# Altium schematic sheet 02_PowerStage.SchDoc
size A3; SheetNumber: 3; SheetTotal: 6
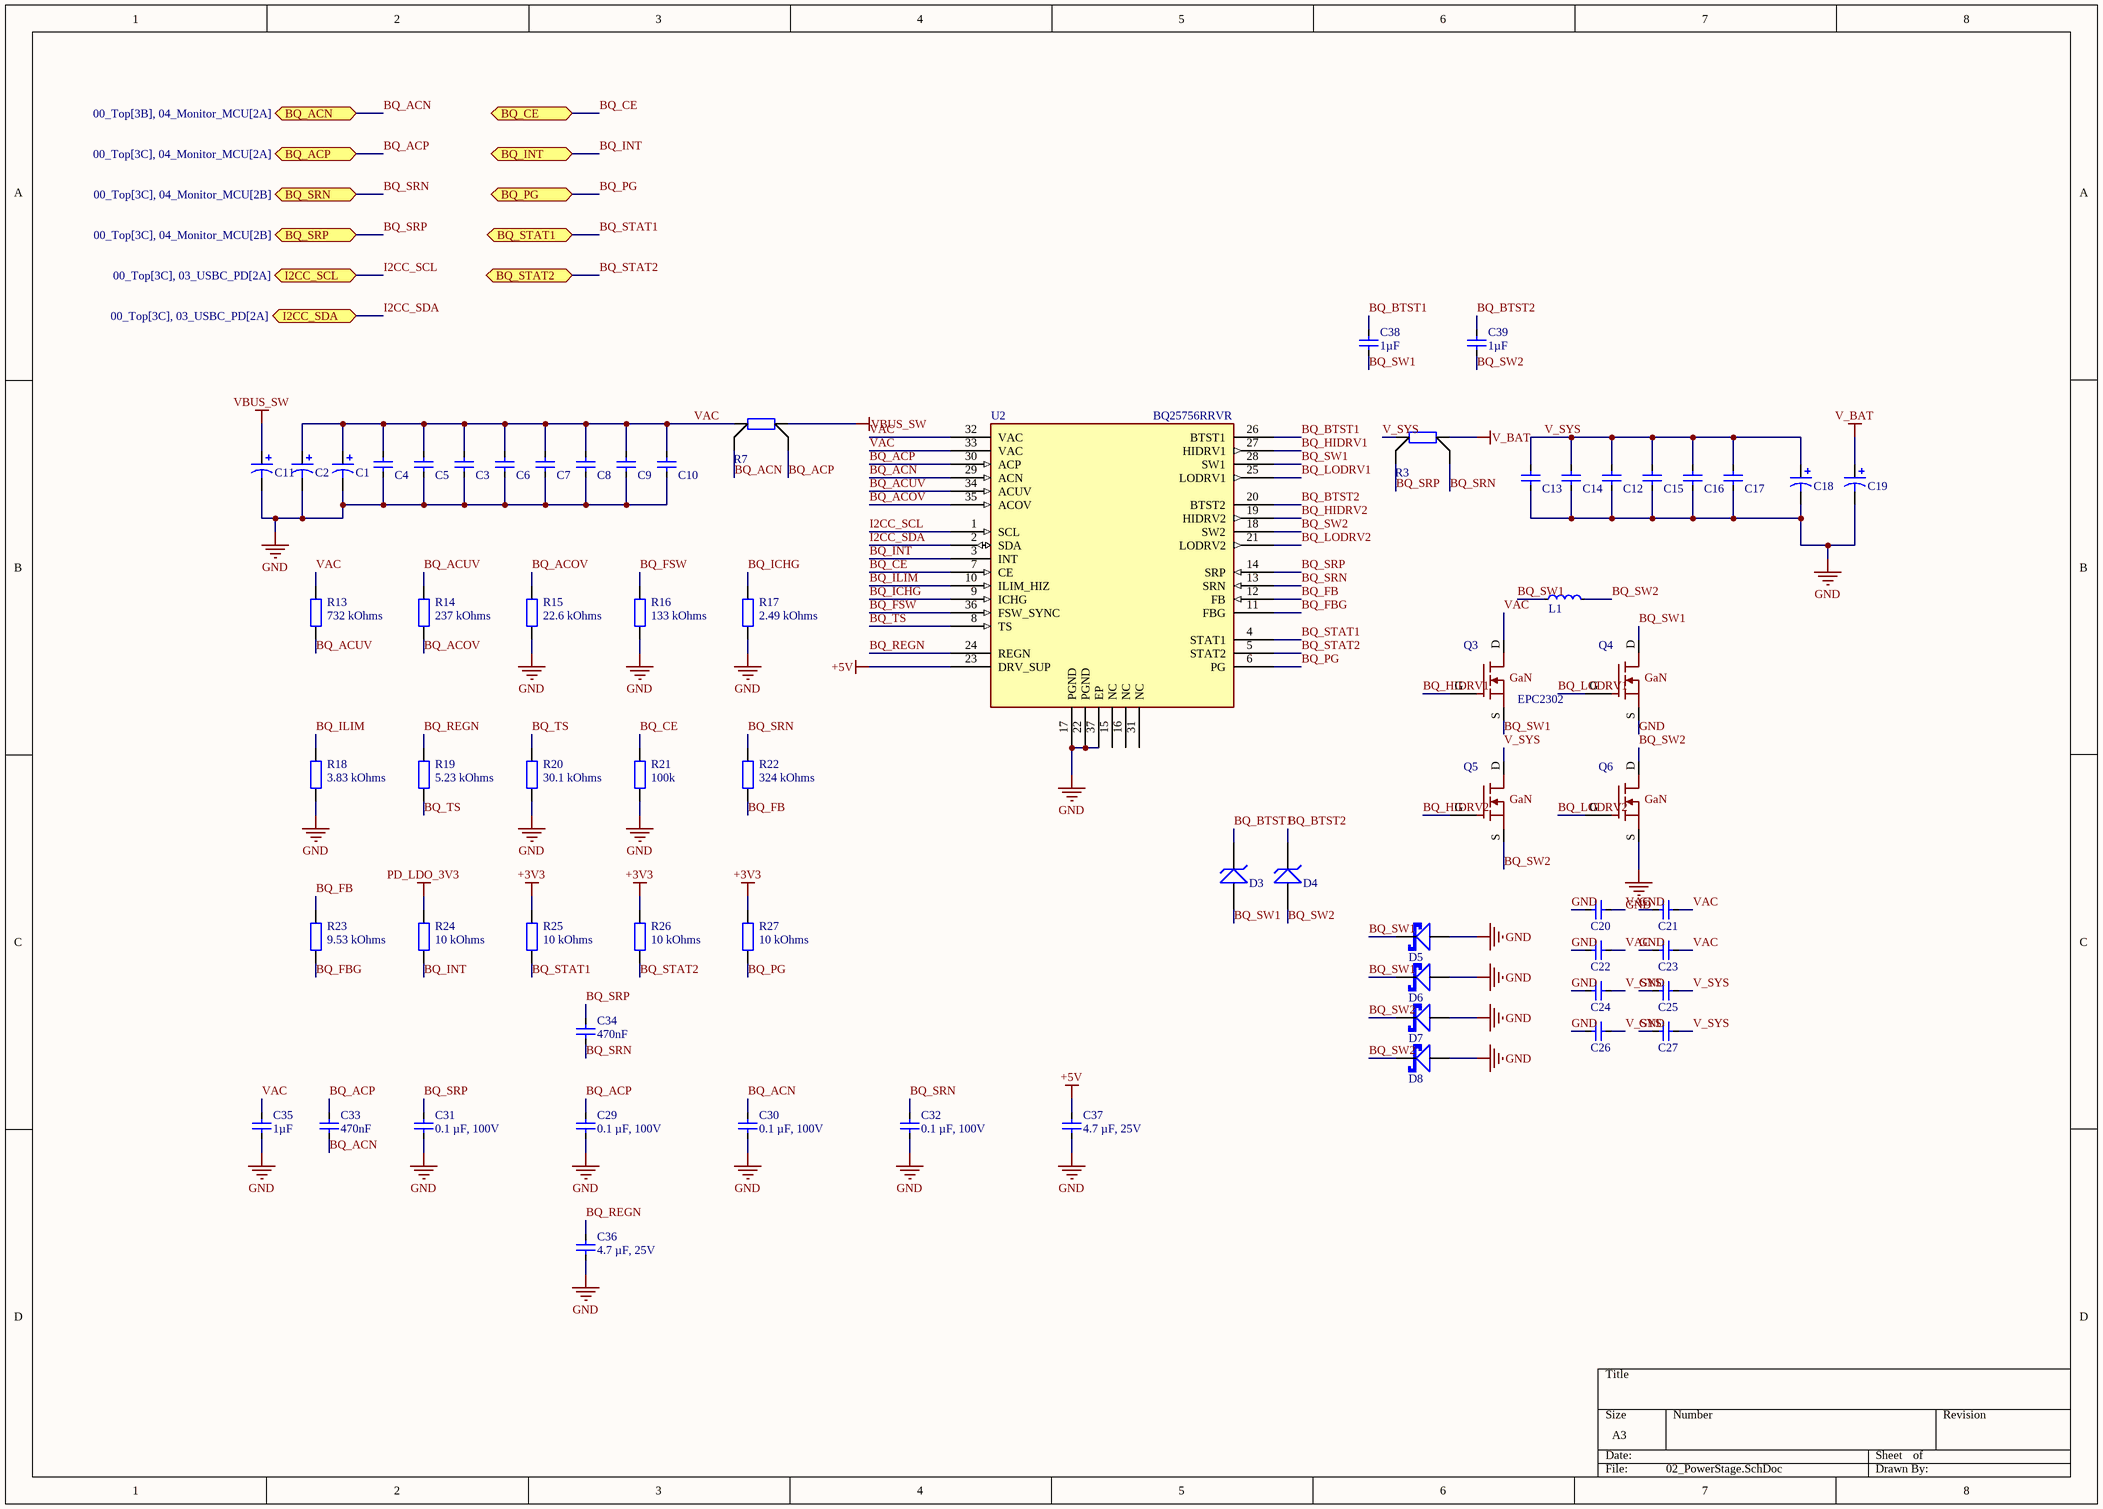
[diagram p0: 02_PowerStage.SchDoc]

## Parts
C1  100µF 80V  [CAPAE1030X1280N]  (value not drawn)
C2  100µF 80V  [CAPAE1030X1280N]  (value not drawn)
C3  10 µF, 100V  [CAPC3225X30N]  (value not drawn)
C4  10 µF, 100V  [CAPC3225X30N]  (value not drawn)
C5  10 µF, 100V  [CAPC3225X30N]  (value not drawn)
C6  10 µF, 100V  [CAPC3225X30N]  (value not drawn)
C7  10 µF, 100V  [CAPC3225X30N]  (value not drawn)
C8  10 µF, 100V  [CAPC3225X30N]  (value not drawn)
C9  10 µF, 100V  [CAPC3225X30N]  (value not drawn)
C10  10 µF, 100V  [CAPC3225X30N]  (value not drawn)
C11  100µF 80V  [CAPAE1030X1280N]  (value not drawn)
C12  10 µF, 100V  [CAPC3225X30N]  (value not drawn)
C13  10 µF, 100V  [CAPC3225X30N]  (value not drawn)
C14  10 µF, 100V  [CAPC3225X30N]  (value not drawn)
C15  10 µF, 100V  [CAPC3225X30N]  (value not drawn)
C16  10 µF, 100V  [CAPC3225X30N]  (value not drawn)
C17  10 µF, 100V  [CAPC3225X30N]  (value not drawn)
C18  100µF 80V  [CAPAE1030X1280N]  (value not drawn)
C19  100µF 80V  [CAPAE1030X1280N]  (value not drawn)
C20  0.1 µF, 100V  [CAPC1608X10N]  (value not drawn)
C21  10000 pF, 100V  [CAPC1608X10N]  (value not drawn)
C22  0.1 µF, 100V  [CAPC1608X10N]  (value not drawn)
C23  10000 pF, 100V  [CAPC1608X10N]  (value not drawn)
C24  0.1 µF, 100V  [CAPC1608X10N]  (value not drawn)
C25  10000 pF, 100V  [CAPC1608X10N]  (value not drawn)
C26  0.1 µF, 100V  [CAPC1608X10N]  (value not drawn)
C27  10000 pF, 100V  [CAPC1608X10N]  (value not drawn)
C29  0.1 µF, 100V  [CAPC1608X10N]
C30  0.1 µF, 100V  [CAPC1608X10N]
C31  0.1 µF, 100V  [CAPC1608X10N]
C32  0.1 µF, 100V  [CAPC1608X10N]
C33  470nF  [CAPC1608X10N]
C34  470nF  [CAPC1608X10N]
C35  1µF  [CAPC3216X20N]
C36  4.7 µF, 25V  [CAPC1608X10N]
C37  4.7 µF, 25V  [CAPC1608X10N]
C38  1µF  [CAPC1608X10N]
C39  1µF  [CAPC1608X10N]
D3  BZX384C5V6-G3-08  [NXP-SOD323]  (value not drawn)
D4  BZX384C5V6-G3-08  [NXP-SOD323]  (value not drawn)
D5  PMEG10030ELPX  [ST-SOD128FLAT]  (value not drawn)
D6  PMEG10030ELPX  [ST-SOD128FLAT]  (value not drawn)
D7  PMEG10030ELPX  [ST-SOD128FLAT]  (value not drawn)
D8  PMEG10030ELPX  [ST-SOD128FLAT]  (value not drawn)
L1  7uH  [WE-HCF_2013]  (value not drawn)
Q3  EPC2302  [TRANS_EPC2302]
Q4  EPC2302  [TRANS_EPC2302]  (value not drawn)
Q5  EPC2302  [TRANS_EPC2302]  (value not drawn)
Q6  EPC2302  [TRANS_EPC2302]  (value not drawn)
R3  5m  [2512-L-4T]  (value not drawn)
R7  5m  [2512-L-4T]  (value not drawn)
R13  732 kOhms  [RESC1005X04N]
R14  237 kOhms  [RESC1005X04N]
R15  22.6 kOhms  [RESC1005X04N]
R16  133 kOhms  [RESC1005X04N]
R17  2.49 kOhms  [RESC1005X04N]
R18  3.83 kOhms  [RESC1005X04N]
R19  5.23 kOhms  [RESC1005X04N]
R20  30.1 kOhms  [RESC1005X04N]
R21  100k  [RESC1005X04N]
R22  324 kOhms  [RESC1608X06N]
R23  9.53 kOhms  [RESC1005X04N]
R24  10 kOhms  [RESC1005X04N]
R25  10 kOhms  [RESC1005X04N]
R26  10 kOhms  [RESC1005X04N]
R27  10 kOhms  [RESC1005X04N]
U2  BQ25756RRVR  [QFN50P500X600X100-37N]

## Ports
BQ_ACN (bidir, see 00_Top[3B], 04_Monitor_MCU[2A]), BQ_ACP (bidir, see 00_Top[3C], 04_Monitor_MCU[2A]), BQ_CE (bidir), BQ_INT (bidir), BQ_PG (bidir), BQ_SRN (bidir, see 00_Top[3C], 04_Monitor_MCU[2B]), BQ_SRP (bidir, see 00_Top[3C], 04_Monitor_MCU[2B]), BQ_STAT1 (bidir), BQ_STAT2 (bidir), I2CC_SCL (bidir, see 00_Top[3C], 03_USBC_PD[2A]), I2CC_SDA (bidir, see 00_Top[3C], 03_USBC_PD[2A])

## Nets
+3V3: R25.2 R26.2 R27.2
+5V: C37.2 U2.23(DRV_SUP)
GND: C1.2 C2.2 C3.1 C4.1 C5.1 C6.1 C7.1 C8.1 C9.1 C10.1 C11.2 C12.1 C13.1 C14.1 C15.1 C16.1 C17.1 C18.2 C19.2 C20.1 C21.1 C22.1 C23.1 C24.1 C25.1 C26.1 C27.1 C29.1 C30.1 C31.1 C32.1 C35.1 C36.1 C37.1 D5.A D6.A D7.A D8.A Q4.S Q6.S R15.1 R16.1 R17.1 R18.1 R20.1 R21.1 U2.17(PGND) U2.22(PGND) U2.37(EP)
PD_LDO_3V3: R24.2
V_BAT: C19.1 R3.2
VBUS_SW: C11.1 R7.2
BQ_ACN: C30.2 C33.1 R7.3 U2.29(ACN) ; port BQ_ACN
BQ_ACOV: R14.1 R15.2 U2.35(ACOV)
BQ_ACP: C29.2 C33.2 R7.4 U2.30(ACP) ; port BQ_ACP
BQ_ACUV: R13.1 R14.2 U2.34(ACUV)
BQ_BTST1: C38.2 D3.K U2.26(BTST1)
BQ_BTST2: C39.2 D4.K U2.20(BTST2)
BQ_CE: R21.2 U2.7(CE) ; port BQ_CE
BQ_FB: R22.1 R23.2 U2.12(FB)
BQ_FBG: R23.1 U2.11(FBG)
BQ_FSW: R16.2 U2.36(FSW_SYNC)
BQ_HIDRV1: Q3.G U2.27(HIDRV1)
BQ_HIDRV2: Q5.G U2.19(HIDRV2)
BQ_ICHG: R17.2 U2.9(ICHG)
BQ_ILIM: R18.2 U2.10(ILIM_HIZ)
BQ_INT: R24.1 U2.3(INT) ; port BQ_INT
BQ_LODRV1: Q4.G U2.25(LODRV1)
BQ_LODRV2: Q6.G U2.21(LODRV2)
BQ_PG: R27.1 U2.6(PG) ; port BQ_PG
BQ_REGN: C36.2 R19.2 U2.24(REGN)
BQ_SRN: C32.2 C34.1 R3.4 R22.2 U2.13(SRN) ; port BQ_SRN
BQ_SRP: C31.2 C34.2 R3.3 U2.14(SRP) ; port BQ_SRP
BQ_STAT1: R25.1 U2.4(STAT1) ; port BQ_STAT1
BQ_STAT2: R26.1 U2.5(STAT2) ; port BQ_STAT2
BQ_SW1: C38.1 D3.A D5.K D6.K L1.1 Q3.S Q4.D U2.28(SW1)
BQ_SW2: C39.1 D4.A D7.K D8.K L1.2 Q5.S Q6.D U2.18(SW2)
BQ_TS: R19.1 R20.2 U2.8(TS)
I2CC_SCL: U2.1(SCL) ; port I2CC_SCL
I2CC_SDA: U2.2(SDA) ; port I2CC_SDA
V_SYS: C12.2 C13.2 C14.2 C15.2 C16.2 C17.2 C18.1 C24.2 C25.2 C26.2 C27.2 Q5.D R3.1
VAC: C1.1 C2.1 C3.2 C4.2 C5.2 C6.2 C7.2 C8.2 C9.2 C10.2 C20.2 C21.2 C22.2 C23.2 C35.2 Q3.D R7.1 R13.2 U2.32(VAC) U2.33(VAC)

Not connected (* = marked no-connect by the designer): U2 15(NC) 16(NC) 31(NC)

## Notes on the sheet
- (in symbol EPC2302) GaN

## Library data of the parts
C1 C2 C11 C18 C19 = B40910A0107M000: CAP ALUM POLY HYB 100UF 80V SMD; Manufacturer 1: TDK; Tolerance: ±20%; Temperature Coefficient: None; AEC-Q200: True; Part Name: B40910A0107M000; Supplier 1: Digi-Key; Supplier Part Number 1: 495-B40910A0107M000TR-ND; Manufacturer Part Number 1: B40910A0107M000; Case Code (Imperial): Radial, Can - SMD; Capacitance: 100 µF; Voltage Rating: 80 V; Mounting Type: Surface Mount
C3-C10 C12-C17 = GRM32EC72A106ME05L: CAP CER 10UF 100V X7S 1210; Manufacturer 1: Murata Electronics; Capacitance: 10 µF; Tolerance: ±20%; AEC-Q200: False; Part Name: GRM32EC72A106ME05L; Supplier 1: Digi-Key; Supplier Part Number 1: 490-GRM32EC72A106ME05LTR-ND; Manufacturer Part Number 1: GRM32EC72A106ME05L; Case Code (Imperial): 1210; Voltage Rating: 100V; Mounting Type: Surface Mount, MLCC; Temperature Coefficient: X7S
C20 C22 C24 C26 = CGA3E3X7S2A104K080AB: CAP CER 0.1UF 100V X7S 0603; Manufacturer 1: TDK; Capacitance: 0.1 µF; Tolerance: ±10%; AEC-Q200: True; Part Name: CGA3E3X7S2A104K080AB; Supplier 1: Digi-Key; Supplier Part Number 1: 445-6938-2-ND; Manufacturer Part Number 1: CGA3E3X7S2A104K080AB; Case Code (Imperial): 0603; Voltage Rating: 100V; Mounting Type: Surface Mount, MLCC; Temperature Coefficient: X7S
C21 C23 C25 C27 = C1608X7R2A103K080AA: CAP CER 10000PF 100V X7R 0603; Manufacturer 1: TDK; Tolerance: ±10%; AEC-Q200: False; Part Name: C1608X7R2A103K080AA; Supplier 1: Digi-Key; Supplier Part Number 1: 445-1304-2-ND; Manufacturer Part Number 1: C1608X7R2A103K080AA; Case Code (Imperial): 0603; Capacitance: 10000 pF; Voltage Rating: 100V; Mounting Type: Surface Mount, MLCC; Temperature Coefficient: X7R
C29-C32 = CGA3E3X7S2A104K080AB: CAP CER 0.1UF 100V X7S 0603; Manufacturer 1: TDK; AEC-Q200: True; Capacitance: 0.1 µF; Tolerance: ±10%; Case Code (Imperial): 0603; Manufacturer Part Number 1: CGA3E3X7S2A104K080AB; Mounting Type: Surface Mount, MLCC; Part Name: CGA3E3X7S2A104K080AB; Supplier 1: Digi-Key; Supplier Part Number 1: 445-6938-2-ND; Temperature Coefficient: X7S; Voltage Rating: 100V
C33 C34 = CGA3E3X7R1H474K080AB: CAP CER 0.47UF 50V X7R 0603; Manufacturer 1: TDK Corporation; AEC-Q200: True; Capacitance: 0.47 µF; Tolerance: ±10%; Case Code (Imperial): 0603; Manufacturer Part Number 1: CGA3E3X7R1H474K080AB; Mounting Type: Surface Mount, MLCC; Part Name: CGA3E3X7R1H474K080AB; Supplier 1: Digi-Key; Supplier Part Number 1: 445-175200-1-ND; Temperature Coefficient: X7R; Voltage Rating: 50V
C35 = CGA5L2X7R2A105M160AA: CAP CER 1UF 100V X7R 1206; Manufacturer 1: TDK Corporation; AEC-Q200: True; Tolerance: ±20%; Capacitance: 1 µF; Case Code (Imperial): 1206; Manufacturer Part Number 1: CGA5L2X7R2A105M160AA; Mounting Type: Surface Mount, MLCC; Part Name: CGA5L2X7R2A105M160AA; Supplier 1: Digi-Key; Supplier Part Number 1: 445-12901-1-ND; Temperature Coefficient: X7R; Voltage Rating: 100V
C36 C37 = GRT188C81E475KE13D: CAP CER 4.7UF 25V X6S 0603; Manufacturer 1: Murata Electronics; AEC-Q200: True; Capacitance: 4.7 µF; Tolerance: ±10%; Case Code (Imperial): 0603; Manufacturer Part Number 1: GRT188C81E475KE13D; Mounting Type: Surface Mount, MLCC; Part Name: GRT188C81E475KE13D; Supplier 1: Digi-Key; Supplier Part Number 1: 490-12295-2-ND; Temperature Coefficient: X6S; Voltage Rating: 25V
C38 C39 = CGA3E1X7R1C105M080AC: CAP CER 1UF 16V X7R 0603; Manufacturer 1: TDK Corporation; AEC-Q200: True; Tolerance: ±20%; Capacitance: 1 µF; Case Code (Imperial): 0603; Manufacturer Part Number 1: CGA3E1X7R1C105M080AC; Mounting Type: 0.063" L x 0.031" W (1.60mm x 0.80mm); Part Name: CGA3E1X7R1C105M080AC; Supplier 1: Digi-Key; Supplier Part Number 1: 445-12540-1-ND; Temperature Coefficient: X7R; Voltage Rating: 16V
D3 D4 = BZX384C5V6-G3-08: DIODE ZENER 5.6V 200MW SOD323; Manufacturer 1: Vishay General Semiconductor - Diodes Division; Diode Type: UKNOWN; Current Average: 1 µA @ 2 V; AEC-Q200: False; Part Name: BZX384C5V6-G3-08; Supplier 1: Digi-Key; Supplier Part Number 1: BZX384C5V6-G3-08GITR-ND; Manufacturer Part Number 1: BZX384C5V6-G3-08; Voltage Forward: -; Voltage Reverse: -; Package / Case: SC-76, SOD-323; Supplier Device Package: SOD-323
D5-D8 = PMEG10030ELPX: DIODE SCHOTTKY 100V 3A SOD128; Manufacturer 1: Nexperia USA Inc.; Voltage Forward: 770 mV @ 3 A; AEC-Q200: False; Part Name: PMEG10030ELPX; Supplier 1: Digi-Key; Supplier Part Number 1: 1727-2397-1-ND; Manufacturer Part Number 1: PMEG10030ELPX; Diode Type: Schottky; Current Average: 3A; Voltage Reverse: 100 V; Package / Case: SOD-128; Supplier Device Package: SOD-128/CFP5
L1 = 7443630700: FIXED IND 7UH 21A 5.61 MOHM SMD; Manufacturer 1: Würth Elektronik; Part Name: 7443630700; Supplier 1: Digi-Key; Supplier Part Number 1: 732-2519-2-ND; Manufacturer Part Number 1: 7443630700
Q3-Q6 = EPC2302: TRANS GAN 100V DIE .0018OHM; Manufacturer 1: EPC; FET Type: N-Channel; AEC-Q200: False; Part Name: EPC2302; Supplier 1: Digi-Key; Supplier Part Number 1: 917-EPC2302TR-ND; Manufacturer Part Number 1: EPC2302; Package / Case: 7-PowerWQFN; Technology: GaNFET (Gallium Nitride); Drain to Source Voltage (Vdss): 100 V; Supplier Device Package: 7-QFN (3x5); Power Dissipation (Max): -
R3 R7 = FC4L64R005FER: RES 0.005 OHM 2W 2512 WIDE; Manufacturer 1: Ohmite; Resistance: 5 mOhms; Tolerance: ±1%; AEC-Q200: False; Part Name: FC4L64R005FER; Supplier 1: Digi-Key; Supplier Part Number 1: FC4L64R005FERCT-ND; Manufacturer Part Number 1: FC4L64R005FER; Case Code (Imperial): 2512; Power (Watts): 2W
R13 = ERJ-2RKF7323X: RES SMD 732K OHM 1% 1/10W 0402; Manufacturer 1: Panasonic Industry; Power (Watts): 0.1W, 1/10W; AEC-Q200: False; Part Name: ERJ-2RKF7323X; Supplier 1: Digi-Key; Supplier Part Number 1: P732KLTR-ND; Manufacturer Part Number 1: ERJ-2RKF7323X; Case Code (Imperial): 0402; Resistance: 732 kOhms; Tolerance: ±1%
R14 = ERJ-2RKF2373X: RES SMD 237K OHM 1% 1/10W 0402; Manufacturer 1: Panasonic Industry; Power (Watts): 0.1W, 1/10W; AEC-Q200: False; Part Name: ERJ-2RKF2373X; Supplier 1: Digi-Key; Supplier Part Number 1: P237KLTR-ND; Manufacturer Part Number 1: ERJ-2RKF2373X; Case Code (Imperial): 0402; Resistance: 237 kOhms; Tolerance: ±1%
R15 = ERJ-2RKF2262X: RES SMD 22.6K OHM 1% 1/10W 0402; Manufacturer 1: Panasonic Industry; Power (Watts): 0.1W, 1/10W; AEC-Q200: False; Part Name: ERJ-2RKF2262X; Supplier 1: Digi-Key; Supplier Part Number 1: P22.6KLTR-ND; Manufacturer Part Number 1: ERJ-2RKF2262X; Case Code (Imperial): 0402; Resistance: 22.6 kOhms; Tolerance: ±1%
R16 = ERJ-2RKF1333X: RES SMD 133K OHM 1% 1/10W 0402; Manufacturer 1: Panasonic Industry; Power (Watts): 0.1W, 1/10W; AEC-Q200: False; Part Name: ERJ-2RKF1333X; Supplier 1: Digi-Key; Supplier Part Number 1: P133KLTR-ND; Manufacturer Part Number 1: ERJ-2RKF1333X; Case Code (Imperial): 0402; Resistance: 133 kOhms; Tolerance: ±1%
R17 = ERJ-2RKF2491X: RES SMD 2.49K OHM 1% 1/10W 0402; Manufacturer 1: Panasonic Industry; Power (Watts): 0.1W, 1/10W; AEC-Q200: False; Part Name: ERJ-2RKF2491X; Supplier 1: Digi-Key; Supplier Part Number 1: P2.49KLTR-ND; Manufacturer Part Number 1: ERJ-2RKF2491X; Case Code (Imperial): 0402; Resistance: 2.49 kOhms; Tolerance: ±1%
R18 = ERJ-2RKF3831X: RES SMD 3.83K OHM 1% 1/10W 0402; Manufacturer 1: Panasonic Industry; Power (Watts): 0.1W, 1/10W; AEC-Q200: False; Part Name: ERJ-2RKF3831X; Supplier 1: Digi-Key; Supplier Part Number 1: P3.83KLTR-ND; Manufacturer Part Number 1: ERJ-2RKF3831X; Case Code (Imperial): 0402; Resistance: 3.83 kOhms; Tolerance: ±1%
R19 = ERJ-2RKF5231X: RES SMD 5.23K OHM 1% 1/10W 0402; Manufacturer 1: Panasonic Industry; Power (Watts): 0.1W, 1/10W; AEC-Q200: False; Part Name: ERJ-2RKF5231X; Supplier 1: Digi-Key; Supplier Part Number 1: P5.23KLTR-ND; Manufacturer Part Number 1: ERJ-2RKF5231X; Case Code (Imperial): 0402; Resistance: 5.23 kOhms; Tolerance: ±1%
R20 = ERJ-2RKF3012X: RES SMD 30.1K OHM 1% 1/10W 0402; Manufacturer 1: Panasonic Industry; Power (Watts): 0.1W, 1/10W; AEC-Q200: False; Part Name: ERJ-2RKF3012X; Supplier 1: Digi-Key; Supplier Part Number 1: P30.1KLTR-ND; Manufacturer Part Number 1: ERJ-2RKF3012X; Case Code (Imperial): 0402; Resistance: 30.1 kOhms; Tolerance: ±1%
R21 = ERJ-2RKF1003X: RES SMD 100K OHM 1% 1/10W 0402; Manufacturer 1: Panasonic Electronic Components; Resistance: 100 kOhms; Power (Watts): 0.1W, 1/10W; AEC-Q200: True; Part Name: ERJ-2RKF1003X; Supplier 1: Digi-Key; Supplier Part Number 1: P100KLCT-ND; Manufacturer Part Number 1: ERJ-2RKF1003X; Case Code (Imperial): 0402; Tolerance: ±1%
R22 = ERA-3AEB3243V: RES SMD 324K OHM 0.1% 1/10W 0603; Manufacturer 1: Panasonic Industry; Power (Watts): 0.1W, 1/10W; AEC-Q200: False; Part Name: ERA-3AEB3243V; Supplier 1: Digi-Key; Supplier Part Number 1: P324KDBTR-ND; Manufacturer Part Number 1: ERA-3AEB3243V; Case Code (Imperial): 0603; Resistance: 324 kOhms; Tolerance: ±0.1%
R23 = ERA-2AEB9531X: RES SMD 9.53KOHM 0.1% 1/16W 0402; Manufacturer 1: Panasonic Industry; Power (Watts): 0.063W, 1/16W; AEC-Q200: False; Part Name: ERA-2AEB9531X; Supplier 1: Digi-Key; Supplier Part Number 1: P9.53KDCTR-ND; Manufacturer Part Number 1: ERA-2AEB9531X; Case Code (Imperial): 0402; Resistance: 9.53 kOhms; Tolerance: ±0.1%
R24-R27 = ERJ-2RKF1002X: RES SMD 10K OHM 1% 1/10W 0402; Manufacturer 1: Panasonic Industry; Power (Watts): 0.1W, 1/10W; AEC-Q200: False; Part Name: ERJ-2RKF1002X; Supplier 1: Digi-Key; Supplier Part Number 1: P10.0KLTR-ND; Manufacturer Part Number 1: ERJ-2RKF1002X; Case Code (Imperial): 0402; Resistance: 10 kOhms; Tolerance: ±1%
U2 = BQ25756RRVR: STAND-ALONE OR IC CONTROLLED 70-; Manufacturer 1: Texas Instruments; AEC-Q200: False; Part Name: BQ25756RRVR; Supplier 1: Digi-Key; Supplier Part Number 1: 296-BQ25756RRVRTR-ND; Manufacturer Part Number 1: BQ25756RRVR; Function: -; Package / Case: 36-VFQFN Exposed Pad; Supplier Device Package: 36-VQFN (5x6)